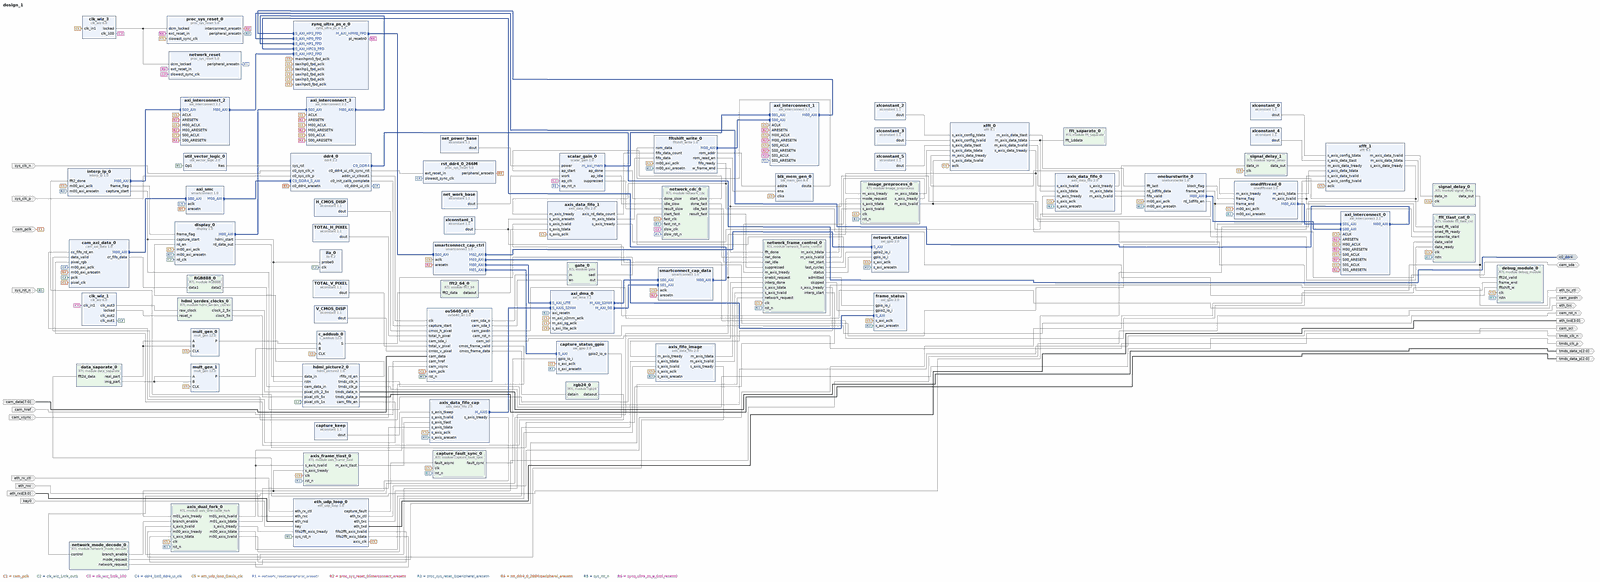
[diagram p0: block diagram of the top level, whole]
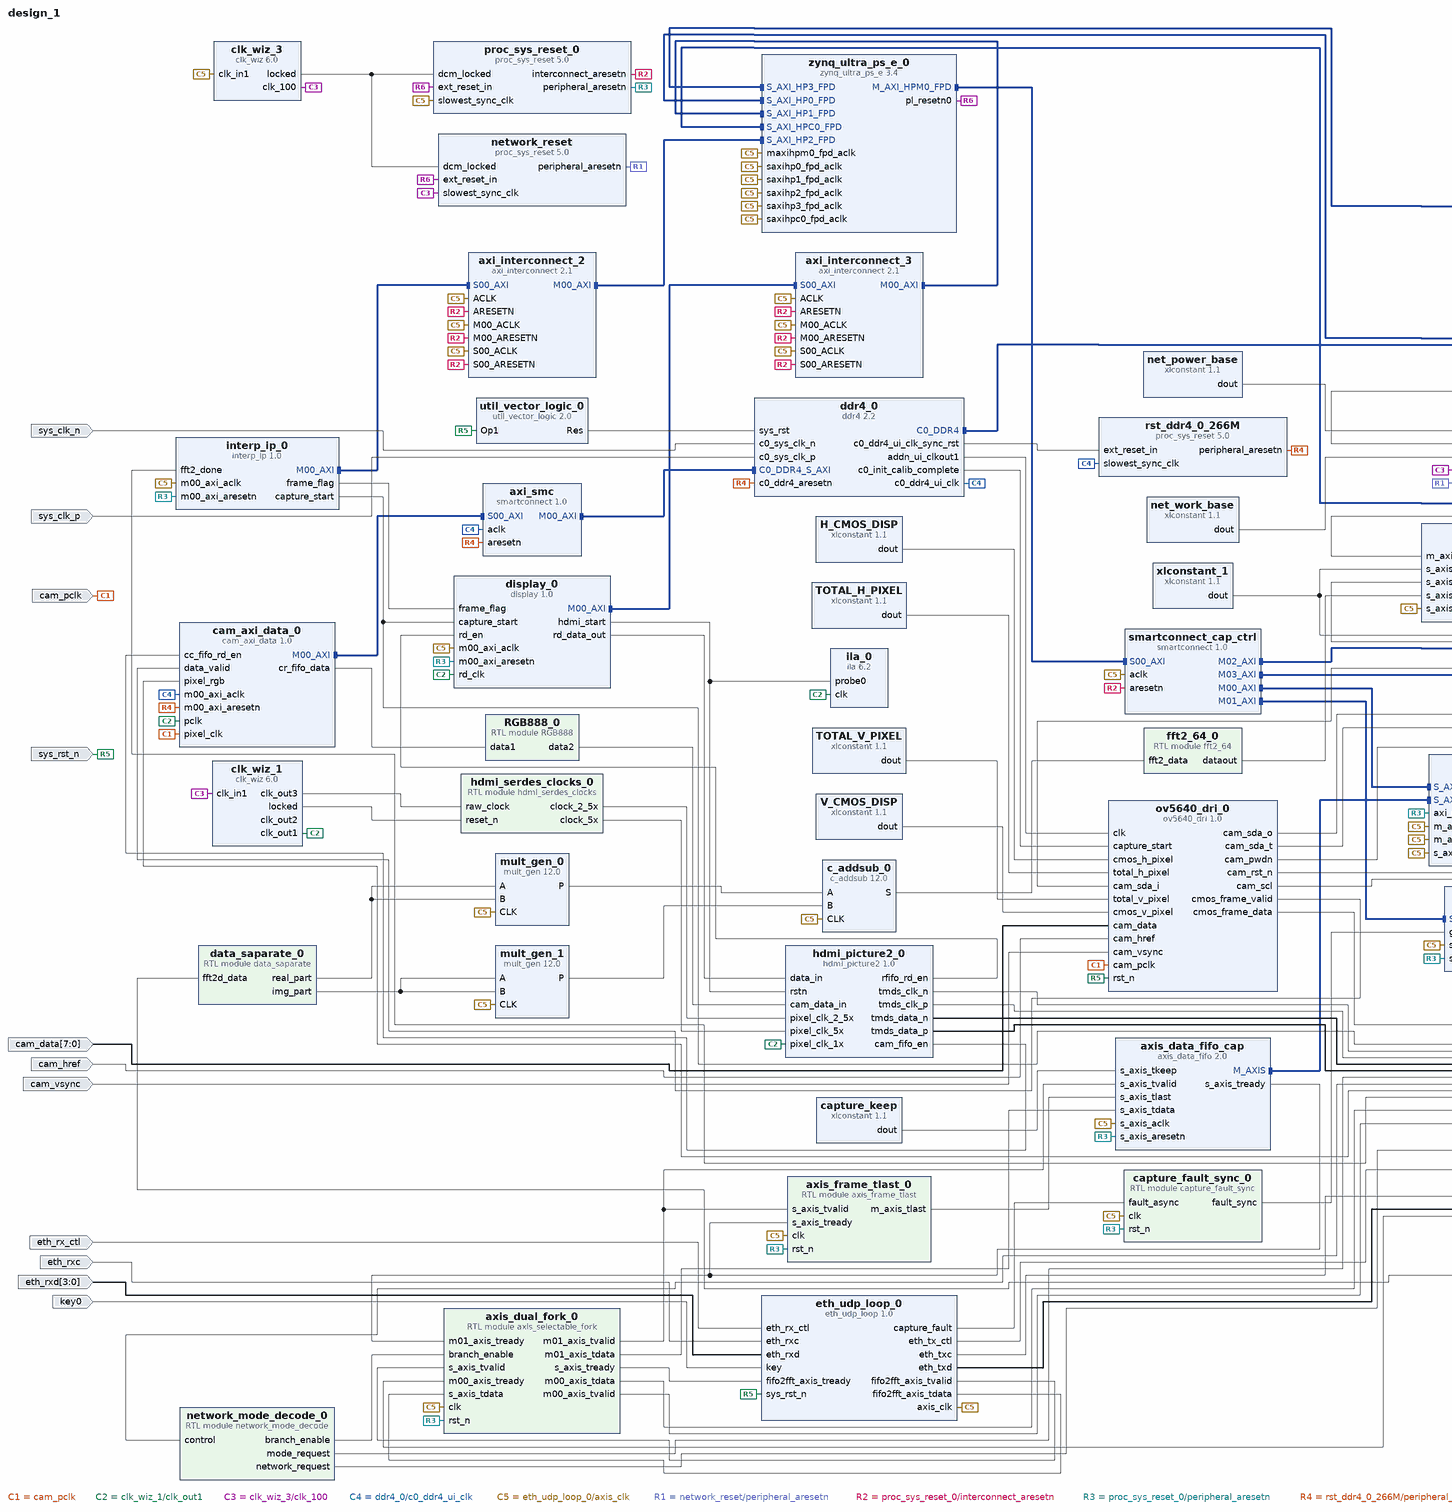
[diagram p1: block diagram of the top level, left part]
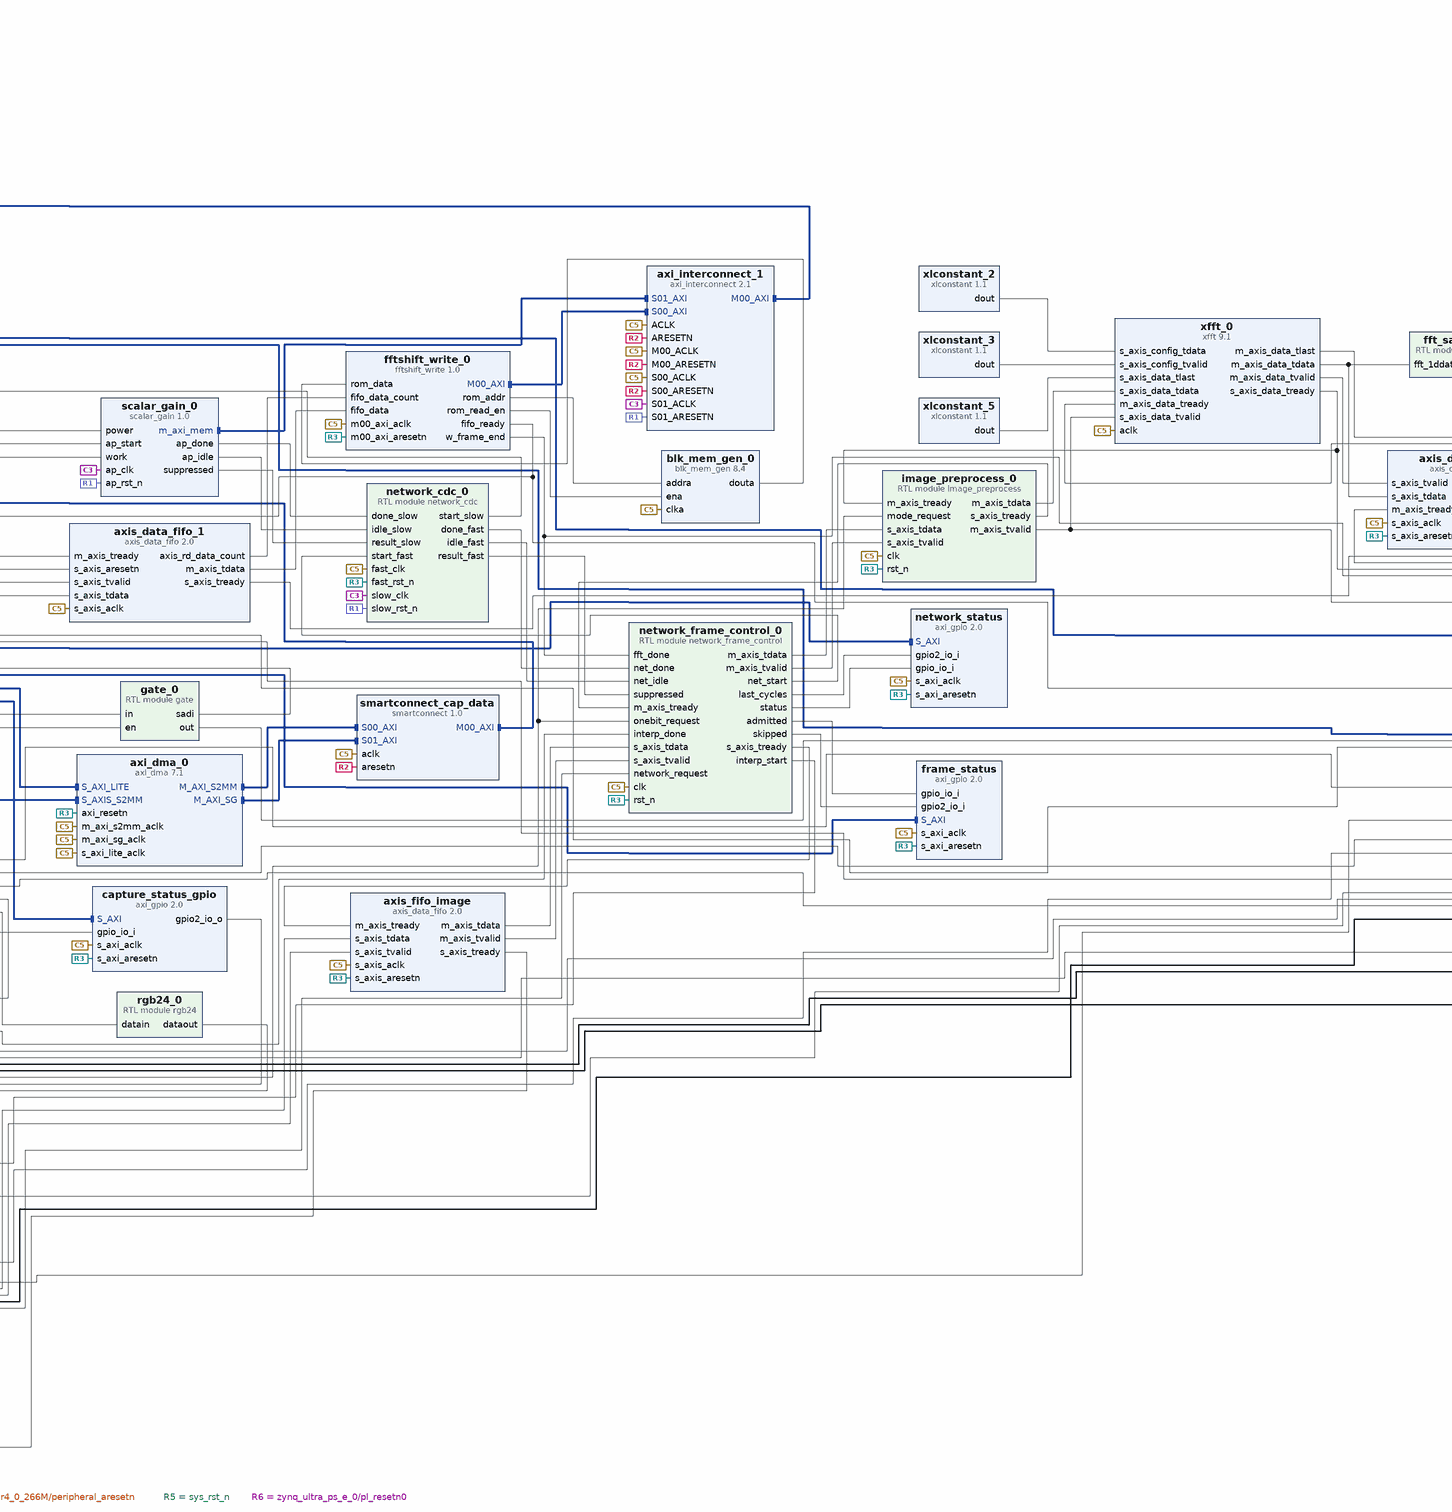
[diagram p2: block diagram of the top level, centre part]
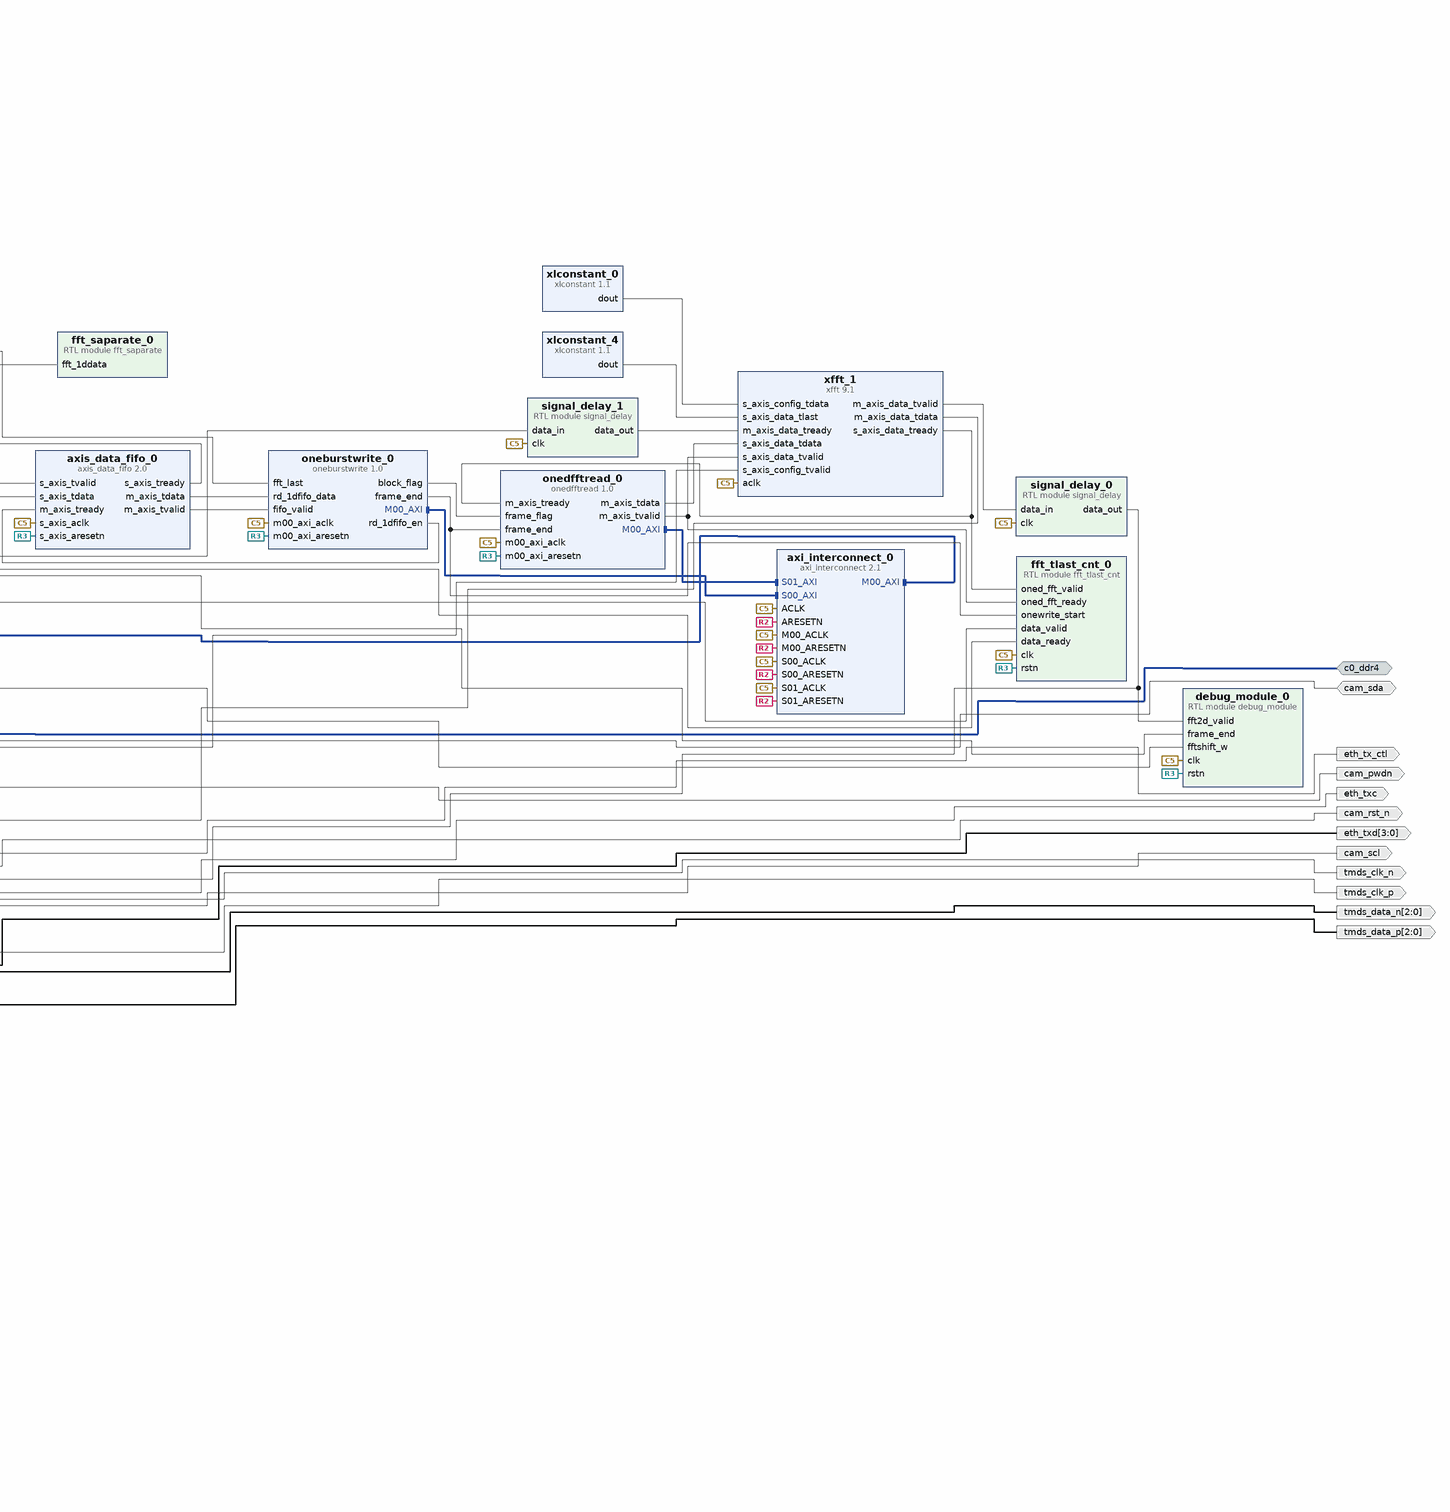
[diagram p3: block diagram of the top level, right part]
# Vivado block design design_1, xczu4ev-sfvc784-1-i, Vivado 2022.1
create_bd_design design_1

create_bd_intf_port -mode Master -vlnv xilinx.com:interface:ddr4_rtl:1.0 c0_ddr4
create_bd_port -dir O -from 2 -to 0 tmds_data_n
create_bd_port -dir O -type clk tmds_clk_n
set_property -dict {CONFIG.ASSOCIATED_RESET rst_n_0} [get_bd_ports tmds_clk_n]
create_bd_port -dir O -type clk tmds_clk_p
create_bd_port -dir O -from 2 -to 0 tmds_data_p
create_bd_port -dir I -type rst sys_rst_n
create_bd_port -dir I key0
create_bd_port -dir I eth_rxc
create_bd_port -dir I eth_rx_ctl
create_bd_port -dir I -from 3 -to 0 eth_rxd
create_bd_port -dir O eth_txc
create_bd_port -dir O eth_tx_ctl
create_bd_port -dir O -from 3 -to 0 eth_txd
create_bd_port -dir I cam_vsync
create_bd_port -dir I cam_href
create_bd_port -dir I -from 7 -to 0 cam_data
create_bd_port -dir O -type rst cam_rst_n
create_bd_port -dir O cam_pwdn
create_bd_port -dir O cam_scl
create_bd_port -dir I -type clk sys_clk_n
create_bd_port -dir I -type clk sys_clk_p
create_bd_port -dir IO cam_sda
create_bd_port -dir I -type clk cam_pclk
set_property -dict {CONFIG.FREQ_HZ 24000000} [get_bd_ports cam_pclk]

create_bd_cell -type ip -vlnv xilinx.com:ip:xfft:9.1 xfft_0
set_property -dict [list \
  CONFIG.aresetn false \
  CONFIG.complex_mult_type use_mults_performance \
  CONFIG.implementation_options radix_4_burst_io \
  CONFIG.memory_options_data block_ram \
  CONFIG.memory_options_hybrid false \
  CONFIG.memory_options_phase_factors block_ram \
  CONFIG.memory_options_reorder block_ram \
  CONFIG.number_of_stages_using_block_ram_for_data_and_phase_factors 0 \
  CONFIG.output_ordering natural_order \
  CONFIG.phase_factor_width 16 \
  CONFIG.rounding_modes convergent_rounding \
  CONFIG.scaling_options unscaled \
  CONFIG.target_clock_frequency 250 \
  CONFIG.throttle_scheme nonrealtime \
  CONFIG.xk_index true \
] [get_bd_cells xfft_0]
create_bd_cell -type ip -vlnv xilinx.com:ip:xlconstant:1.1 xlconstant_2
set_property -dict {CONFIG.CONST_WIDTH 8} [get_bd_cells xlconstant_2]
create_bd_cell -type ip -vlnv xilinx.com:ip:xlconstant:1.1 xlconstant_3
create_bd_cell -type ip -vlnv xilinx.com:ip:zynq_ultra_ps_e:3.4 zynq_ultra_ps_e_0
set_property -dict [list \
  CONFIG.CAN0_BOARD_INTERFACE custom \
  CONFIG.CAN1_BOARD_INTERFACE custom \
  CONFIG.CSU_BOARD_INTERFACE custom \
  CONFIG.DP_BOARD_INTERFACE custom \
  CONFIG.GEM0_BOARD_INTERFACE custom \
  CONFIG.GEM1_BOARD_INTERFACE custom \
  CONFIG.GEM2_BOARD_INTERFACE custom \
  CONFIG.GEM3_BOARD_INTERFACE custom \
  CONFIG.GPIO_BOARD_INTERFACE custom \
  CONFIG.IIC0_BOARD_INTERFACE custom \
  CONFIG.IIC1_BOARD_INTERFACE custom \
  CONFIG.NAND_BOARD_INTERFACE custom \
  CONFIG.PCIE_BOARD_INTERFACE custom \
  CONFIG.PJTAG_BOARD_INTERFACE custom \
  CONFIG.PMU_BOARD_INTERFACE custom \
  CONFIG.PSU_BANK_0_IO_STANDARD LVCMOS18 \
  CONFIG.PSU_BANK_1_IO_STANDARD LVCMOS33 \
  CONFIG.PSU_BANK_2_IO_STANDARD LVCMOS18 \
  CONFIG.PSU_BANK_3_IO_STANDARD LVCMOS33 \
  CONFIG.PSU_USB3__DUAL_CLOCK_ENABLE 0 \
  CONFIG.PSU__CAN1__PERIPHERAL__ENABLE 0 \
  CONFIG.PSU__CRF_APB__ACPU_CTRL__FREQMHZ 1200 \
  CONFIG.PSU__CRF_APB__ACPU_CTRL__SRCSEL APLL \
  CONFIG.PSU__CRF_APB__APLL_CTRL__SRCSEL PSS_REF_CLK \
  CONFIG.PSU__CRF_APB__DBG_FPD_CTRL__FREQMHZ 250 \
  CONFIG.PSU__CRF_APB__DBG_FPD_CTRL__SRCSEL IOPLL \
  CONFIG.PSU__CRF_APB__DBG_TRACE_CTRL__FREQMHZ 250 \
  CONFIG.PSU__CRF_APB__DBG_TRACE_CTRL__SRCSEL IOPLL \
  CONFIG.PSU__CRF_APB__DBG_TSTMP_CTRL__FREQMHZ 250 \
  CONFIG.PSU__CRF_APB__DBG_TSTMP_CTRL__SRCSEL IOPLL \
  CONFIG.PSU__CRF_APB__DDR_CTRL__FREQMHZ 1200 \
  CONFIG.PSU__CRF_APB__DDR_CTRL__SRCSEL DPLL \
  CONFIG.PSU__CRF_APB__DPDMA_REF_CTRL__FREQMHZ 600 \
  CONFIG.PSU__CRF_APB__DPDMA_REF_CTRL__SRCSEL DPLL \
  CONFIG.PSU__CRF_APB__DPLL_CTRL__SRCSEL PSS_REF_CLK \
  CONFIG.PSU__CRF_APB__DP_AUDIO_REF_CTRL__SRCSEL VPLL \
  CONFIG.PSU__CRF_APB__DP_STC_REF_CTRL__SRCSEL VPLL \
  CONFIG.PSU__CRF_APB__DP_VIDEO_REF_CTRL__SRCSEL DPLL \
  CONFIG.PSU__CRF_APB__GDMA_REF_CTRL__FREQMHZ 600 \
  CONFIG.PSU__CRF_APB__GDMA_REF_CTRL__SRCSEL DPLL \
  CONFIG.PSU__CRF_APB__GPU_REF_CTRL__FREQMHZ 600 \
  CONFIG.PSU__CRF_APB__GPU_REF_CTRL__SRCSEL DPLL \
  CONFIG.PSU__CRF_APB__TOPSW_LSBUS_CTRL__FREQMHZ 100 \
  CONFIG.PSU__CRF_APB__TOPSW_LSBUS_CTRL__SRCSEL IOPLL \
  CONFIG.PSU__CRF_APB__TOPSW_MAIN_CTRL__FREQMHZ 533.333 \
  CONFIG.PSU__CRF_APB__TOPSW_MAIN_CTRL__SRCSEL VPLL \
  CONFIG.PSU__CRF_APB__VPLL_CTRL__SRCSEL PSS_REF_CLK \
  CONFIG.PSU__CRL_APB__ADMA_REF_CTRL__FREQMHZ 500 \
  CONFIG.PSU__CRL_APB__ADMA_REF_CTRL__SRCSEL IOPLL \
  CONFIG.PSU__CRL_APB__CAN1_REF_CTRL__FREQMHZ 100 \
  CONFIG.PSU__CRL_APB__CAN1_REF_CTRL__SRCSEL IOPLL \
  CONFIG.PSU__CRL_APB__CPU_R5_CTRL__FREQMHZ 500 \
  CONFIG.PSU__CRL_APB__CPU_R5_CTRL__SRCSEL IOPLL \
  CONFIG.PSU__CRL_APB__DBG_LPD_CTRL__FREQMHZ 250 \
  CONFIG.PSU__CRL_APB__DBG_LPD_CTRL__SRCSEL IOPLL \
  CONFIG.PSU__CRL_APB__GEM3_REF_CTRL__FREQMHZ 125 \
  CONFIG.PSU__CRL_APB__GEM3_REF_CTRL__SRCSEL IOPLL \
  CONFIG.PSU__CRL_APB__I2C0_REF_CTRL__FREQMHZ 100 \
  CONFIG.PSU__CRL_APB__I2C0_REF_CTRL__SRCSEL IOPLL \
  CONFIG.PSU__CRL_APB__I2C1_REF_CTRL__FREQMHZ 100 \
  CONFIG.PSU__CRL_APB__I2C1_REF_CTRL__SRCSEL IOPLL \
  CONFIG.PSU__CRL_APB__IOPLL_CTRL__SRCSEL PSS_REF_CLK \
  CONFIG.PSU__CRL_APB__IOU_SWITCH_CTRL__FREQMHZ 267 \
  CONFIG.PSU__CRL_APB__IOU_SWITCH_CTRL__SRCSEL RPLL \
  CONFIG.PSU__CRL_APB__LPD_LSBUS_CTRL__FREQMHZ 100 \
  CONFIG.PSU__CRL_APB__LPD_LSBUS_CTRL__SRCSEL IOPLL \
  CONFIG.PSU__CRL_APB__LPD_SWITCH_CTRL__FREQMHZ 500 \
  CONFIG.PSU__CRL_APB__LPD_SWITCH_CTRL__SRCSEL IOPLL \
  CONFIG.PSU__CRL_APB__PCAP_CTRL__FREQMHZ 200 \
  CONFIG.PSU__CRL_APB__PCAP_CTRL__SRCSEL IOPLL \
  CONFIG.PSU__CRL_APB__QSPI_REF_CTRL__FREQMHZ 300 \
  CONFIG.PSU__CRL_APB__QSPI_REF_CTRL__SRCSEL IOPLL \
  CONFIG.PSU__CRL_APB__RPLL_CTRL__SRCSEL PSS_REF_CLK \
  CONFIG.PSU__CRL_APB__SDIO1_REF_CTRL__FREQMHZ 200 \
  CONFIG.PSU__CRL_APB__SDIO1_REF_CTRL__SRCSEL RPLL \
  CONFIG.PSU__CRL_APB__TIMESTAMP_REF_CTRL__FREQMHZ 100 \
  CONFIG.PSU__CRL_APB__TIMESTAMP_REF_CTRL__SRCSEL PSS_REF_CLK \
  CONFIG.PSU__CRL_APB__UART0_REF_CTRL__FREQMHZ 100 \
  CONFIG.PSU__CRL_APB__UART0_REF_CTRL__SRCSEL IOPLL \
  CONFIG.PSU__CRL_APB__UART1_REF_CTRL__FREQMHZ 100 \
  CONFIG.PSU__CRL_APB__UART1_REF_CTRL__SRCSEL IOPLL \
  CONFIG.PSU__CRL_APB__USB0_BUS_REF_CTRL__FREQMHZ 250 \
  CONFIG.PSU__CRL_APB__USB0_BUS_REF_CTRL__SRCSEL IOPLL \
  CONFIG.PSU__CRL_APB__USB3_DUAL_REF_CTRL__FREQMHZ 20 \
  CONFIG.PSU__CRL_APB__USB3_DUAL_REF_CTRL__SRCSEL IOPLL \
  CONFIG.PSU__CRL_APB__USB3__ENABLE 0 \
  CONFIG.PSU__CSUPMU__PERIPHERAL__VALID 0 \
  CONFIG.PSU__DDRC__BUS_WIDTH {64 Bit} \
  CONFIG.PSU__DDRC__COMPONENTS Components \
  CONFIG.PSU__DDRC__DEVICE_CAPACITY {4096 MBits} \
  CONFIG.PSU__DDRC__DRAM_WIDTH {16 Bits} \
  CONFIG.PSU__DDRC__ECC Disabled \
  CONFIG.PSU__DDRC__MEMORY_TYPE {DDR 4} \
  CONFIG.PSU__DDRC__SPEED_BIN DDR4_2400P \
  CONFIG.PSU__DDR_HIGH_ADDRESS_GUI_ENABLE 0 \
  CONFIG.PSU__DDR__INTERFACE__FREQMHZ 600.000 \
  CONFIG.PSU__DEVICE_TYPE EV \
  CONFIG.PSU__DISPLAYPORT__PERIPHERAL__ENABLE 0 \
  CONFIG.PSU__DLL__ISUSED 1 \
  CONFIG.PSU__ENET3__PERIPHERAL__ENABLE 0 \
  CONFIG.PSU__FPD_SLCR__WDT1__FREQMHZ 100 \
  CONFIG.PSU__FPGA_PL0_ENABLE 0 \
  CONFIG.PSU__GPIO0_MIO__PERIPHERAL__ENABLE 0 \
  CONFIG.PSU__GPIO1_MIO__PERIPHERAL__ENABLE 0 \
  CONFIG.PSU__GPIO_EMIO__PERIPHERAL__ENABLE 1 \
  CONFIG.PSU__GPIO_EMIO__PERIPHERAL__IO 1 \
  CONFIG.PSU__I2C0__PERIPHERAL__ENABLE 0 \
  CONFIG.PSU__I2C1__PERIPHERAL__ENABLE 0 \
  CONFIG.PSU__IOU_SLCR__IOU_TTC_APB_CLK__TTC0_SEL APB \
  CONFIG.PSU__IOU_SLCR__IOU_TTC_APB_CLK__TTC1_SEL APB \
  CONFIG.PSU__IOU_SLCR__IOU_TTC_APB_CLK__TTC2_SEL APB \
  CONFIG.PSU__IOU_SLCR__IOU_TTC_APB_CLK__TTC3_SEL APB \
  CONFIG.PSU__IOU_SLCR__TTC0__FREQMHZ 100 \
  CONFIG.PSU__IOU_SLCR__TTC1__FREQMHZ 100 \
  CONFIG.PSU__IOU_SLCR__TTC2__FREQMHZ 100 \
  CONFIG.PSU__IOU_SLCR__TTC3__FREQMHZ 100 \
  CONFIG.PSU__IOU_SLCR__WDT0__FREQMHZ 100 \
  CONFIG.PSU__LPD_SLCR__CSUPMU__FREQMHZ 100 \
  CONFIG.PSU__MAXIGP0__DATA_WIDTH 128 \
  CONFIG.PSU__OVERRIDE_HPX_QOS 0 \
  CONFIG.PSU__OVERRIDE__BASIC_CLOCK 0 \
  CONFIG.PSU__PMU__PERIPHERAL__ENABLE 0 \
  CONFIG.PSU__PRESET_APPLIED 0 \
  CONFIG.PSU__PSS_REF_CLK__FREQMHZ 33.333 \
  CONFIG.PSU__QSPI__PERIPHERAL__ENABLE 0 \
  CONFIG.PSU__SATA__PERIPHERAL__ENABLE 0 \
  CONFIG.PSU__SAXIGP2__DATA_WIDTH 64 \
  CONFIG.PSU__SAXIGP3__DATA_WIDTH 64 \
  CONFIG.PSU__SAXIGP4__DATA_WIDTH 64 \
  CONFIG.PSU__SAXIGP5__DATA_WIDTH 64 \
  CONFIG.PSU__SD0__CLK_100_SDR_OTAP_DLY 0x3 \
  CONFIG.PSU__SD0__CLK_200_SDR_OTAP_DLY 0x3 \
  CONFIG.PSU__SD0__CLK_50_DDR_ITAP_DLY 0x3D \
  CONFIG.PSU__SD0__CLK_50_DDR_OTAP_DLY 0x4 \
  CONFIG.PSU__SD0__CLK_50_SDR_ITAP_DLY 0x15 \
  CONFIG.PSU__SD0__CLK_50_SDR_OTAP_DLY 0x5 \
  CONFIG.PSU__SD1_COHERENCY 0 \
  CONFIG.PSU__SD1_ROUTE_THROUGH_FPD 0 \
  CONFIG.PSU__SD1__CLK_50_SDR_ITAP_DLY 0x15 \
  CONFIG.PSU__SD1__CLK_50_SDR_OTAP_DLY 0x5 \
  CONFIG.PSU__SD1__DATA_TRANSFER_MODE 4Bit \
  CONFIG.PSU__SD1__GRP_CD__ENABLE 1 \
  CONFIG.PSU__SD1__GRP_CD__IO {MIO 45} \
  CONFIG.PSU__SD1__GRP_POW__ENABLE 0 \
  CONFIG.PSU__SD1__GRP_WP__ENABLE 0 \
  CONFIG.PSU__SD1__PERIPHERAL__ENABLE 1 \
  CONFIG.PSU__SD1__PERIPHERAL__IO {MIO 46 .. 51} \
  CONFIG.PSU__SD1__SLOT_TYPE {SD 2.0} \
  CONFIG.PSU__SWDT0__PERIPHERAL__ENABLE 0 \
  CONFIG.PSU__SWDT1__PERIPHERAL__ENABLE 0 \
  CONFIG.PSU__TTC0__PERIPHERAL__ENABLE 0 \
  CONFIG.PSU__TTC1__PERIPHERAL__ENABLE 0 \
  CONFIG.PSU__TTC2__PERIPHERAL__ENABLE 0 \
  CONFIG.PSU__TTC3__PERIPHERAL__ENABLE 0 \
  CONFIG.PSU__UART0__BAUD_RATE 115200 \
  CONFIG.PSU__UART0__MODEM__ENABLE 0 \
  CONFIG.PSU__UART0__PERIPHERAL__ENABLE 1 \
  CONFIG.PSU__UART0__PERIPHERAL__IO {MIO 42 .. 43} \
  CONFIG.PSU__UART1__PERIPHERAL__ENABLE 0 \
  CONFIG.PSU__USB0__PERIPHERAL__ENABLE 0 \
  CONFIG.PSU__USE__IRQ0 0 \
  CONFIG.PSU__USE__M_AXI_GP0 1 \
  CONFIG.PSU__USE__M_AXI_GP1 0 \
  CONFIG.PSU__USE__M_AXI_GP2 0 \
  CONFIG.PSU__USE__S_AXI_GP0 1 \
  CONFIG.PSU__USE__S_AXI_GP2 1 \
  CONFIG.PSU__USE__S_AXI_GP3 1 \
  CONFIG.PSU__USE__S_AXI_GP4 1 \
  CONFIG.PSU__USE__S_AXI_GP5 1 \
  CONFIG.QSPI_BOARD_INTERFACE custom \
  CONFIG.SATA_BOARD_INTERFACE custom \
  CONFIG.SD0_BOARD_INTERFACE custom \
  CONFIG.SD1_BOARD_INTERFACE custom \
  CONFIG.SPI0_BOARD_INTERFACE custom \
  CONFIG.SPI1_BOARD_INTERFACE custom \
  CONFIG.SUBPRESET1 DDR4_MICRON_MT40A256M16GE_083E \
  CONFIG.SUBPRESET2 Custom \
  CONFIG.SWDT0_BOARD_INTERFACE custom \
  CONFIG.SWDT1_BOARD_INTERFACE custom \
  CONFIG.TRACE_BOARD_INTERFACE custom \
  CONFIG.TTC0_BOARD_INTERFACE custom \
  CONFIG.TTC1_BOARD_INTERFACE custom \
  CONFIG.TTC2_BOARD_INTERFACE custom \
  CONFIG.TTC3_BOARD_INTERFACE custom \
  CONFIG.UART0_BOARD_INTERFACE custom \
  CONFIG.UART1_BOARD_INTERFACE custom \
  CONFIG.USB0_BOARD_INTERFACE custom \
  CONFIG.USB1_BOARD_INTERFACE custom \
  CONFIG.preset None \
] [get_bd_cells zynq_ultra_ps_e_0]
# 743 more settings of zynq_ultra_ps_e_0 are not shown: defaults, MIO pin electricals, DDR timing, and values the tool derives
create_bd_cell -type module -reference fft_saparate fft_saparate_0
create_bd_cell -type ip -vlnv xilinx.com:ip:proc_sys_reset:5.0 proc_sys_reset_0
create_bd_cell -type ip -vlnv xilinx.com:ip:axi_interconnect:2.1 axi_interconnect_0
set_property -dict [list \
  CONFIG.ENABLE_ADVANCED_OPTIONS 0 \
  CONFIG.NUM_MI 1 \
  CONFIG.NUM_SI 2 \
  CONFIG.S00_ARB_PRIORITY 0 \
  CONFIG.S01_ARB_PRIORITY 0 \
  CONFIG.S02_ARB_PRIORITY 1 \
] [get_bd_cells axi_interconnect_0]
create_bd_cell -type ip -vlnv xilinx.com:ip:xfft:9.1 xfft_1
set_property -dict [list \
  CONFIG.complex_mult_type use_mults_performance \
  CONFIG.implementation_options radix_4_burst_io \
  CONFIG.input_width 27 \
  CONFIG.number_of_stages_using_block_ram_for_data_and_phase_factors 0 \
  CONFIG.output_ordering natural_order \
  CONFIG.rounding_modes convergent_rounding \
  CONFIG.scaling_options unscaled \
  CONFIG.transform_length 512 \
  CONFIG.xk_index true \
] [get_bd_cells xfft_1]
create_bd_cell -type ip -vlnv xilinx.com:ip:xlconstant:1.1 xlconstant_0
set_property -dict {CONFIG.CONST_WIDTH 8} [get_bd_cells xlconstant_0]
create_bd_cell -type ip -vlnv xilinx.com:ip:xlconstant:1.1 xlconstant_1
create_bd_cell -type ip -vlnv xilinx.com:ip:xlconstant:1.1 xlconstant_4
set_property -dict {CONFIG.CONST_VAL 0} [get_bd_cells xlconstant_4]
create_bd_cell -type module -reference fft_tlast_cnt fft_tlast_cnt_0
create_bd_cell -type ip -vlnv xilinx.com:ip:mult_gen:12.0 mult_gen_0
set_property -dict [list \
  CONFIG.ClockEnable false \
  CONFIG.PipeStages 7 \
  CONFIG.PortAWidth 37 \
  CONFIG.PortBWidth 37 \
] [get_bd_cells mult_gen_0]
create_bd_cell -type ip -vlnv xilinx.com:ip:mult_gen:12.0 mult_gen_1
set_property -dict {CONFIG.PipeStages 7 CONFIG.PortAWidth 37 CONFIG.PortBWidth 37} [get_bd_cells mult_gen_1]
create_bd_cell -type ip -vlnv xilinx.com:ip:c_addsub:12.0 c_addsub_0
set_property -dict [list \
  CONFIG.A_Width 74 \
  CONFIG.B_Value 00000000000000000000000000000000000000000000000000000000000000000000000000 \
  CONFIG.B_Width 74 \
  CONFIG.CE false \
  CONFIG.Latency 4 \
  CONFIG.Out_Width 74 \
] [get_bd_cells c_addsub_0]
create_bd_cell -type ip -vlnv xilinx.com:ip:axis_data_fifo:2.0 axis_data_fifo_1
set_property -dict [list \
  CONFIG.FIFO_DEPTH 2048 \
  CONFIG.FIFO_MEMORY_TYPE ultra \
  CONFIG.HAS_RD_DATA_COUNT 1 \
  CONFIG.TDATA_NUM_BYTES 8 \
] [get_bd_cells axis_data_fifo_1]
create_bd_cell -type module -reference signal_delay signal_delay_0
create_bd_cell -type module -reference signal_delay signal_delay_1
create_bd_cell -type ip -vlnv xilinx.com:ip:blk_mem_gen:8.4 blk_mem_gen_0
set_property -dict [list \
  CONFIG.Coe_File ../../../../../../../FFTSHIFT.coe \
  CONFIG.Enable_32bit_Address false \
  CONFIG.Load_Init_File true \
  CONFIG.Memory_Type Single_Port_ROM \
  CONFIG.Port_A_Write_Rate 0 \
  CONFIG.Register_PortA_Output_of_Memory_Primitives false \
  CONFIG.Use_RSTA_Pin false \
  CONFIG.Write_Depth_A 2048 \
  CONFIG.use_bram_block Stand_Alone \
] [get_bd_cells blk_mem_gen_0]
create_bd_cell -type ip -vlnv xilinx.com:ip:axi_interconnect:2.1 axi_interconnect_1
set_property -dict [list \
  CONFIG.ENABLE_ADVANCED_OPTIONS 0 \
  CONFIG.NUM_MI 1 \
  CONFIG.NUM_SI 2 \
  CONFIG.S00_ARB_PRIORITY 0 \
  CONFIG.S01_ARB_PRIORITY 1 \
] [get_bd_cells axi_interconnect_1]
create_bd_cell -type module -reference debug_module debug_module_0
create_bd_cell -type ip -vlnv xilinx.com:ip:axi_interconnect:2.1 axi_interconnect_2
set_property -dict {CONFIG.NUM_MI 1 CONFIG.NUM_SI 1} [get_bd_cells axi_interconnect_2]
create_bd_cell -type ip -vlnv xilinx.com:ip:clk_wiz:6.0 clk_wiz_1
set_property -dict [list \
  CONFIG.CLKOUT1_JITTER 250.227 \
  CONFIG.CLKOUT1_PHASE_ERROR 394.762 \
  CONFIG.CLKOUT1_REQUESTED_OUT_FREQ 74.25 \
  CONFIG.CLKOUT2_JITTER 222.018 \
  CONFIG.CLKOUT2_PHASE_ERROR 394.762 \
  CONFIG.CLKOUT2_REQUESTED_OUT_FREQ 185.625 \
  CONFIG.CLKOUT2_USED true \
  CONFIG.CLKOUT3_DRIVES No_buffer \
  CONFIG.CLKOUT3_JITTER 203.119 \
  CONFIG.CLKOUT3_PHASE_ERROR 394.762 \
  CONFIG.CLKOUT3_REQUESTED_OUT_FREQ 371.25 \
  CONFIG.CLKOUT3_USED true \
  CONFIG.MMCM_CLKFBOUT_MULT_F 111.375 \
  CONFIG.MMCM_CLKOUT0_DIVIDE_F 15.000 \
  CONFIG.MMCM_CLKOUT1_DIVIDE 6 \
  CONFIG.MMCM_CLKOUT2_DIVIDE 3 \
  CONFIG.MMCM_DIVCLK_DIVIDE 10 \
  CONFIG.NUM_OUT_CLKS 3 \
  CONFIG.OPTIMIZE_CLOCKING_STRUCTURE_EN true \
  CONFIG.USE_LOCKED true \
  CONFIG.USE_RESET false \
] [get_bd_cells clk_wiz_1]
create_bd_cell -type ip -vlnv xilinx.com:ip:axi_interconnect:2.1 axi_interconnect_3
set_property -dict {CONFIG.NUM_MI 1} [get_bd_cells axi_interconnect_3]
create_bd_cell -type ip -vlnv xilinx.com:ip:axis_data_fifo:2.0 axis_data_fifo_0
set_property -dict [list \
  CONFIG.ENABLE_ECC 0 \
  CONFIG.FIFO_DEPTH 16384 \
  CONFIG.FIFO_MEMORY_TYPE ultra \
  CONFIG.FIFO_MODE 1 \
  CONFIG.HAS_RD_DATA_COUNT 1 \
  CONFIG.HAS_WR_DATA_COUNT 1 \
  CONFIG.TDATA_NUM_BYTES 8 \
] [get_bd_cells axis_data_fifo_0]
create_bd_cell -type ip -vlnv xilinx.com:user:onedfftread:1.0 onedfftread_0
set_property -dict [list \
  CONFIG.C_M00_AXI_BURST_LEN 256 \
  CONFIG.C_M00_AXI_DATA_WIDTH 64 \
  CONFIG.C_M00_AXI_TARGET_SLAVE_BASE_ADDR 0x02000000 \
] [get_bd_cells onedfftread_0]
create_bd_cell -type module -reference data_saparate data_saparate_0
create_bd_cell -type module -reference fft2_64 fft2_64_0
create_bd_cell -type ip -vlnv xilinx.com:ip:xlconstant:1.1 xlconstant_5
set_property -dict {CONFIG.CONST_VAL 0} [get_bd_cells xlconstant_5]
create_bd_cell -type ip -vlnv xilinx.com:ip:clk_wiz:6.0 clk_wiz_3
set_property -dict [list \
  CONFIG.CLKIN1_JITTER_PS 40.0 \
  CONFIG.CLKOUT1_DRIVES Buffer \
  CONFIG.CLKOUT1_JITTER 107.111 \
  CONFIG.CLKOUT1_PHASE_ERROR 85.928 \
  CONFIG.CLKOUT1_REQUESTED_OUT_FREQ 100 \
  CONFIG.CLKOUT2_DRIVES Buffer \
  CONFIG.CLKOUT2_JITTER 107.111 \
  CONFIG.CLKOUT2_PHASE_ERROR 85.928 \
  CONFIG.CLKOUT2_USED false \
  CONFIG.CLKOUT3_DRIVES Buffer \
  CONFIG.CLKOUT4_DRIVES Buffer \
  CONFIG.CLKOUT5_DRIVES Buffer \
  CONFIG.CLKOUT6_DRIVES Buffer \
  CONFIG.CLKOUT7_DRIVES Buffer \
  CONFIG.CLK_OUT1_PORT clk_100 \
  CONFIG.CLK_OUT2_PORT clk_100 \
  CONFIG.MMCM_BANDWIDTH OPTIMIZED \
  CONFIG.MMCM_CLKFBOUT_MULT_F 4 \
  CONFIG.MMCM_CLKIN1_PERIOD 4.000 \
  CONFIG.MMCM_CLKIN2_PERIOD 10.0 \
  CONFIG.MMCM_CLKOUT0_DIVIDE_F 10 \
  CONFIG.MMCM_CLKOUT1_DIVIDE 1 \
  CONFIG.MMCM_COMPENSATION AUTO \
  CONFIG.MMCM_DIVCLK_DIVIDE 1 \
  CONFIG.NUM_OUT_CLKS 1 \
  CONFIG.PRIMITIVE PLL \
  CONFIG.PRIM_IN_FREQ 250.000 \
  CONFIG.USE_RESET false \
] [get_bd_cells clk_wiz_3]
create_bd_cell -type ip -vlnv xilinx.com:user:oneburstwrite:1.0 oneburstwrite_0
set_property -dict [list \
  CONFIG.C_M00_AXI_BURST_LEN 1 \
  CONFIG.C_M00_AXI_DATA_WIDTH 64 \
  CONFIG.C_M00_AXI_TARGET_SLAVE_BASE_ADDR 0x02000000 \
] [get_bd_cells oneburstwrite_0]
create_bd_cell -type ip -vlnv xilinx.com:user:ov5640_dri:1.0 ov5640_dri_0
create_bd_cell -type ip -vlnv xilinx.com:ip:ddr4:2.2 ddr4_0
set_property -dict [list \
  CONFIG.ADDN_UI_CLKOUT1_FREQ_HZ 50 \
  CONFIG.C0.BANK_GROUP_WIDTH 1 \
  CONFIG.C0.DDR4_AxiAddressWidth 29 \
  CONFIG.C0.DDR4_AxiDataWidth 32 \
  CONFIG.C0.DDR4_DataWidth 16 \
  CONFIG.C0.DDR4_InputClockPeriod 10006 \
  CONFIG.C0.DDR4_MemoryPart MT40A256M16GE-083E \
] [get_bd_cells ddr4_0]
create_bd_cell -type ip -vlnv xilinx.com:ip:util_vector_logic:2.0 util_vector_logic_0
set_property -dict {CONFIG.C_OPERATION not CONFIG.C_SIZE 1} [get_bd_cells util_vector_logic_0]
create_bd_cell -type module -reference gate gate_0
create_bd_cell -type module -reference rgb24 rgb24_0
create_bd_cell -type ip -vlnv xilinx.com:ip:smartconnect:1.0 axi_smc
set_property -dict {CONFIG.NUM_SI 1} [get_bd_cells axi_smc]
create_bd_cell -type ip -vlnv xilinx.com:ip:proc_sys_reset:5.0 rst_ddr4_0_266M
create_bd_cell -type module -reference RGB888 RGB888_0
create_bd_cell -type ip -vlnv xilinx.com:ip:xlconstant:1.1 H_CMOS_DISP
set_property -dict {CONFIG.CONST_VAL 480 CONFIG.CONST_WIDTH 13} [get_bd_cells H_CMOS_DISP]
create_bd_cell -type ip -vlnv xilinx.com:ip:xlconstant:1.1 V_CMOS_DISP
set_property -dict {CONFIG.CONST_VAL 272 CONFIG.CONST_WIDTH 13} [get_bd_cells V_CMOS_DISP]
create_bd_cell -type ip -vlnv xilinx.com:ip:xlconstant:1.1 TOTAL_H_PIXEL
set_property -dict {CONFIG.CONST_VAL 1800 CONFIG.CONST_WIDTH 13} [get_bd_cells TOTAL_H_PIXEL]
create_bd_cell -type ip -vlnv xilinx.com:ip:xlconstant:1.1 TOTAL_V_PIXEL
set_property -dict {CONFIG.CONST_VAL 1000 CONFIG.CONST_WIDTH 13} [get_bd_cells TOTAL_V_PIXEL]
create_bd_cell -type ip -vlnv xilinx.com:ip:ila:6.2 ila_0
set_property -dict {CONFIG.C_ENABLE_ILA_AXI_MON false CONFIG.C_MONITOR_TYPE Native CONFIG.C_NUM_OF_PROBES 1} [get_bd_cells ila_0]
create_bd_cell -type ip -vlnv xilinx.com:user:eth_udp_loop:1.0 eth_udp_loop_0
set_property -dict {CONFIG.DES_MAC 0x123456789012} [get_bd_cells eth_udp_loop_0]
create_bd_cell -type ip -vlnv xilinx.com:ip:axis_data_fifo:2.0 axis_fifo_image
set_property -dict [list \
  CONFIG.FIFO_DEPTH 16384 \
  CONFIG.FIFO_MEMORY_TYPE ultra \
  CONFIG.HAS_RD_DATA_COUNT 1 \
  CONFIG.HAS_TKEEP 0 \
  CONFIG.HAS_TLAST 0 \
  CONFIG.TDATA_NUM_BYTES 4 \
] [get_bd_cells axis_fifo_image]
create_bd_cell -type ip -vlnv xilinx.com:ip:axis_data_fifo:2.0 axis_data_fifo_cap
set_property -dict [list \
  CONFIG.FIFO_DEPTH 4096 \
  CONFIG.FIFO_MEMORY_TYPE ultra \
  CONFIG.HAS_RD_DATA_COUNT 1 \
  CONFIG.HAS_TKEEP 1 \
  CONFIG.HAS_TLAST 1 \
  CONFIG.TDATA_NUM_BYTES 4 \
] [get_bd_cells axis_data_fifo_cap]
create_bd_cell -type module -reference image_preprocess image_preprocess_0
create_bd_cell -type module -reference axis_frame_tlast axis_frame_tlast_0
create_bd_cell -type ip -vlnv xilinx.com:ip:xlconstant:1.1 capture_keep
set_property -dict {CONFIG.CONST_VAL 15 CONFIG.CONST_WIDTH 4} [get_bd_cells capture_keep]
create_bd_cell -type ip -vlnv xilinx.com:ip:axi_dma:7.1 axi_dma_0
set_property -dict [list \
  CONFIG.c_addr_width 32 \
  CONFIG.c_include_mm2s 0 \
  CONFIG.c_include_s2mm 1 \
  CONFIG.c_include_sg 1 \
  CONFIG.c_m_axi_s2mm_data_width 32 \
  CONFIG.c_s2mm_burst_size 16 \
  CONFIG.c_s_axis_s2mm_tdata_width 32 \
  CONFIG.c_sg_include_stscntrl_strm 0 \
  CONFIG.c_sg_length_width 23 \
] [get_bd_cells axi_dma_0]
create_bd_cell -type ip -vlnv xilinx.com:ip:smartconnect:1.0 smartconnect_cap_data
set_property -dict {CONFIG.NUM_MI 1 CONFIG.NUM_SI 2} [get_bd_cells smartconnect_cap_data]
create_bd_cell -type ip -vlnv xilinx.com:ip:smartconnect:1.0 smartconnect_cap_ctrl
set_property -dict {CONFIG.NUM_MI 4 CONFIG.NUM_SI 1} [get_bd_cells smartconnect_cap_ctrl]
create_bd_cell -type ip -vlnv xilinx.com:ip:axi_gpio:2.0 capture_status_gpio
set_property -dict [list \
  CONFIG.C_ALL_INPUTS 1 \
  CONFIG.C_ALL_INPUTS_2 0 \
  CONFIG.C_ALL_OUTPUTS_2 1 \
  CONFIG.C_DOUT_DEFAULT_2 0x00000000 \
  CONFIG.C_GPIO2_WIDTH 4 \
  CONFIG.C_GPIO_WIDTH 4 \
  CONFIG.C_IS_DUAL 1 \
] [get_bd_cells capture_status_gpio]
create_bd_cell -type module -reference capture_fault_sync capture_fault_sync_0
create_bd_cell -type module -reference axis_selectable_fork axis_dual_fork_0
create_bd_cell -type module -reference network_frame_control network_frame_control_0
create_bd_cell -type module -reference network_cdc network_cdc_0
create_bd_cell -type ip -vlnv xilinx.com:ip:proc_sys_reset:5.0 network_reset
create_bd_cell -type ip -vlnv xilinx.com:ip:xlconstant:1.1 net_power_base
set_property -dict {CONFIG.CONST_VAL 0x24000000 CONFIG.CONST_WIDTH 32} [get_bd_cells net_power_base]
create_bd_cell -type ip -vlnv xilinx.com:ip:xlconstant:1.1 net_work_base
set_property -dict {CONFIG.CONST_VAL 0x31000000 CONFIG.CONST_WIDTH 32} [get_bd_cells net_work_base]
create_bd_cell -type module -reference network_mode_decode network_mode_decode_0
create_bd_cell -type ip -vlnv xilinx.com:ip:axi_gpio:2.0 network_status
set_property -dict [list \
  CONFIG.C_ALL_INPUTS 1 \
  CONFIG.C_ALL_INPUTS_2 1 \
  CONFIG.C_GPIO2_WIDTH 32 \
  CONFIG.C_GPIO_WIDTH 32 \
  CONFIG.C_IS_DUAL 1 \
] [get_bd_cells network_status]
create_bd_cell -type ip -vlnv xilinx.com:ip:axi_gpio:2.0 frame_status
set_property -dict [list \
  CONFIG.C_ALL_INPUTS 1 \
  CONFIG.C_ALL_INPUTS_2 1 \
  CONFIG.C_GPIO2_WIDTH 32 \
  CONFIG.C_GPIO_WIDTH 32 \
  CONFIG.C_IS_DUAL 1 \
] [get_bd_cells frame_status]
create_bd_cell -type ip -vlnv xilinx.com:user:fftshift_write:1.0 fftshift_write_0
set_property -dict [list \
  CONFIG.C_M00_AXI_BURST_LEN 256 \
  CONFIG.C_M00_AXI_DATA_WIDTH 64 \
  CONFIG.C_M00_AXI_TARGET_SLAVE_BASE_ADDR 0x24000000 \
] [get_bd_cells fftshift_write_0]
create_bd_cell -type module -reference hdmi_serdes_clocks hdmi_serdes_clocks_0
create_bd_cell -type ip -vlnv xilinx.com:user:cam_axi_data:1.0 cam_axi_data_0
set_property -dict [list \
  CONFIG.C_M00_AXI_BURST_LEN 256 \
  CONFIG.C_M00_AXI_TARGET_SLAVE_BASE_ADDR 0x80000000 \
] [get_bd_cells cam_axi_data_0]
create_bd_cell -type ip -vlnv xilinx.com:user:display:1.0 display_0
set_property -dict [list \
  CONFIG.C_M00_AXI_BURST_LEN 256 \
  CONFIG.C_M00_AXI_DATA_WIDTH 64 \
  CONFIG.C_M00_AXI_TARGET_SLAVE_BASE_ADDR 0x25000000 \
] [get_bd_cells display_0]
create_bd_cell -type ip -vlnv xilinx.com:user:hdmi_picture2:1.0 hdmi_picture2_0
create_bd_cell -type ip -vlnv xilinx.com:user:interp_ip:1.0 interp_ip_0
set_property -dict [list \
  CONFIG.C_M00_AXI_BURST_LEN 1 \
  CONFIG.C_M00_AXI_DATA_WIDTH 64 \
  CONFIG.C_M00_AXI_TARGET_SLAVE_BASE_ADDR 0x20000000 \
] [get_bd_cells interp_ip_0]
create_bd_cell -type ip -vlnv local:radar:scalar_gain:1.0 scalar_gain_0

# ---- connections ----

connect_bd_intf_net [get_bd_intf_pins axi_dma_0/M_AXI_S2MM] [get_bd_intf_pins smartconnect_cap_data/S00_AXI]
connect_bd_intf_net [get_bd_intf_pins axi_dma_0/M_AXI_SG] [get_bd_intf_pins smartconnect_cap_data/S01_AXI]
connect_bd_intf_net [get_bd_intf_pins axi_interconnect_0/M00_AXI] [get_bd_intf_pins zynq_ultra_ps_e_0/S_AXI_HP0_FPD]
connect_bd_intf_net [get_bd_intf_pins zynq_ultra_ps_e_0/S_AXI_HP3_FPD] [get_bd_intf_pins axi_interconnect_1/M00_AXI]
connect_bd_intf_net [get_bd_intf_pins axi_interconnect_2/M00_AXI] [get_bd_intf_pins zynq_ultra_ps_e_0/S_AXI_HP2_FPD]
connect_bd_intf_net [get_bd_intf_pins axi_interconnect_3/M00_AXI] [get_bd_intf_pins zynq_ultra_ps_e_0/S_AXI_HP1_FPD]
connect_bd_intf_net [get_bd_intf_pins axi_smc/M00_AXI] [get_bd_intf_pins ddr4_0/C0_DDR4_S_AXI]
connect_bd_intf_net [get_bd_intf_pins axis_data_fifo_cap/M_AXIS] [get_bd_intf_pins axi_dma_0/S_AXIS_S2MM]
connect_bd_intf_net [get_bd_intf_pins cam_axi_data_0/M00_AXI] [get_bd_intf_pins axi_smc/S00_AXI]
connect_bd_intf_net [get_bd_intf_ports c0_ddr4] [get_bd_intf_pins ddr4_0/C0_DDR4]
connect_bd_intf_net [get_bd_intf_pins display_0/M00_AXI] [get_bd_intf_pins axi_interconnect_3/S00_AXI]
connect_bd_intf_net [get_bd_intf_pins fftshift_write_0/M00_AXI] [get_bd_intf_pins axi_interconnect_1/S00_AXI]
connect_bd_intf_net [get_bd_intf_pins interp_ip_0/M00_AXI] [get_bd_intf_pins axi_interconnect_2/S00_AXI]
connect_bd_intf_net [get_bd_intf_pins oneburstwrite_0/M00_AXI] [get_bd_intf_pins axi_interconnect_0/S00_AXI]
connect_bd_intf_net [get_bd_intf_pins onedfftread_0/M00_AXI] [get_bd_intf_pins axi_interconnect_0/S01_AXI]
connect_bd_intf_net [get_bd_intf_pins scalar_gain_0/m_axi_mem] [get_bd_intf_pins axi_interconnect_1/S01_AXI]
connect_bd_intf_net [get_bd_intf_pins smartconnect_cap_ctrl/M00_AXI] [get_bd_intf_pins axi_dma_0/S_AXI_LITE]
connect_bd_intf_net [get_bd_intf_pins smartconnect_cap_ctrl/M01_AXI] [get_bd_intf_pins capture_status_gpio/S_AXI]
connect_bd_intf_net [get_bd_intf_pins smartconnect_cap_ctrl/M02_AXI] [get_bd_intf_pins network_status/S_AXI]
connect_bd_intf_net [get_bd_intf_pins smartconnect_cap_ctrl/M03_AXI] [get_bd_intf_pins frame_status/S_AXI]
connect_bd_intf_net [get_bd_intf_pins smartconnect_cap_data/M00_AXI] [get_bd_intf_pins zynq_ultra_ps_e_0/S_AXI_HPC0_FPD]
connect_bd_intf_net [get_bd_intf_pins zynq_ultra_ps_e_0/M_AXI_HPM0_FPD] [get_bd_intf_pins smartconnect_cap_ctrl/S00_AXI]
connect_bd_net -net DATA_RDAXI_0_m_axis_tvalid [get_bd_pins eth_udp_loop_0/fifo2fft_axis_tvalid] [get_bd_pins axis_dual_fork_0/s_axis_tvalid]
connect_bd_net [get_bd_pins H_CMOS_DISP/dout] [get_bd_pins ov5640_dri_0/cmos_h_pixel]
connect_bd_net [get_bd_ports cam_sda] [get_bd_pins gate_0/out]
connect_bd_net [get_bd_pins RGB888_0/data2] [get_bd_pins hdmi_picture2_0/cam_data_in]
connect_bd_net [get_bd_pins TOTAL_H_PIXEL/dout] [get_bd_pins ov5640_dri_0/total_h_pixel]
connect_bd_net [get_bd_pins TOTAL_V_PIXEL/dout] [get_bd_pins ov5640_dri_0/total_v_pixel]
connect_bd_net [get_bd_pins V_CMOS_DISP/dout] [get_bd_pins ov5640_dri_0/cmos_v_pixel]
connect_bd_net [get_bd_pins axis_data_fifo_0/m_axis_tdata] [get_bd_pins oneburstwrite_0/rd_1dfifo_data]
connect_bd_net [get_bd_pins axis_data_fifo_0/m_axis_tvalid] [get_bd_pins oneburstwrite_0/fifo_valid]
connect_bd_net [get_bd_pins axis_data_fifo_0/s_axis_tready] [get_bd_pins xfft_0/m_axis_data_tready]
connect_bd_net [get_bd_pins axis_data_fifo_1/axis_rd_data_count] [get_bd_pins fftshift_write_0/fifo_data_count]
connect_bd_net [get_bd_pins axis_data_fifo_1/m_axis_tdata] [get_bd_pins fftshift_write_0/fifo_data]
connect_bd_net [get_bd_pins axis_data_fifo_1/s_axis_tready] [get_bd_pins signal_delay_1/data_in]
connect_bd_net [get_bd_pins axis_data_fifo_cap/s_axis_tready] \
  [get_bd_pins axis_frame_tlast_0/s_axis_tready] [get_bd_pins axis_dual_fork_0/m01_axis_tready]
connect_bd_net [get_bd_pins axis_dual_fork_0/m00_axis_tdata] [get_bd_pins axis_fifo_image/s_axis_tdata]
connect_bd_net [get_bd_pins axis_dual_fork_0/m00_axis_tvalid] [get_bd_pins axis_fifo_image/s_axis_tvalid]
connect_bd_net [get_bd_pins axis_dual_fork_0/m01_axis_tdata] [get_bd_pins axis_data_fifo_cap/s_axis_tdata]
connect_bd_net [get_bd_pins axis_dual_fork_0/m01_axis_tvalid] \
  [get_bd_pins axis_data_fifo_cap/s_axis_tvalid] [get_bd_pins axis_frame_tlast_0/s_axis_tvalid]
connect_bd_net [get_bd_pins axis_fifo_image/m_axis_tdata] [get_bd_pins network_frame_control_0/s_axis_tdata]
connect_bd_net [get_bd_pins axis_fifo_image/m_axis_tvalid] [get_bd_pins network_frame_control_0/s_axis_tvalid]
connect_bd_net [get_bd_pins axis_fifo_image/s_axis_tready] [get_bd_pins axis_dual_fork_0/m00_axis_tready]
connect_bd_net [get_bd_pins axis_frame_tlast_0/m_axis_tlast] [get_bd_pins axis_data_fifo_cap/s_axis_tlast]
connect_bd_net [get_bd_pins blk_mem_gen_0/douta] [get_bd_pins fftshift_write_0/rom_data]
connect_bd_net -net c0_sys_clk_n_0_1 [get_bd_ports sys_clk_n] [get_bd_pins ddr4_0/c0_sys_clk_n]
connect_bd_net -net c0_sys_clk_p_0_1 [get_bd_ports sys_clk_p] [get_bd_pins ddr4_0/c0_sys_clk_p]
connect_bd_net [get_bd_pins c_addsub_0/S] [get_bd_pins fft2_64_0/fft2_data]
connect_bd_net [get_bd_pins cam_axi_data_0/cr_fifo_data] [get_bd_pins RGB888_0/data1]
connect_bd_net -net cam_data_0_1 [get_bd_ports cam_data] [get_bd_pins ov5640_dri_0/cam_data]
connect_bd_net -net cam_href_0_1 [get_bd_ports cam_href] [get_bd_pins ov5640_dri_0/cam_href]
connect_bd_net [get_bd_ports cam_pclk] [get_bd_pins ov5640_dri_0/cam_pclk] [get_bd_pins cam_axi_data_0/pixel_clk]
connect_bd_net -net cam_vsync_0_1 [get_bd_ports cam_vsync] [get_bd_pins ov5640_dri_0/cam_vsync]
connect_bd_net [get_bd_pins capture_fault_sync_0/fault_sync] [get_bd_pins capture_status_gpio/gpio_io_i]
connect_bd_net [get_bd_pins capture_keep/dout] [get_bd_pins axis_data_fifo_cap/s_axis_tkeep]
connect_bd_net -net capture_mode_decode_0_branch_enable [get_bd_pins network_mode_decode_0/branch_enable] [get_bd_pins axis_dual_fork_0/branch_enable]
connect_bd_net [get_bd_pins capture_status_gpio/gpio2_io_o] [get_bd_pins network_mode_decode_0/control]
connect_bd_net [get_bd_pins clk_wiz_1/clk_out1] \
  [get_bd_pins ila_0/clk] [get_bd_pins cam_axi_data_0/pclk] [get_bd_pins display_0/rd_clk] \
  [get_bd_pins hdmi_picture2_0/pixel_clk_1x]
# net clk_wiz_1_clk_out2 has one end: clk_wiz_1/clk_out2
connect_bd_net [get_bd_pins clk_wiz_1/clk_out3] [get_bd_pins hdmi_serdes_clocks_0/raw_clock]
connect_bd_net [get_bd_pins clk_wiz_1/locked] [get_bd_pins hdmi_serdes_clocks_0/reset_n]
connect_bd_net [get_bd_pins clk_wiz_3/clk_100] \
  [get_bd_pins clk_wiz_1/clk_in1] [get_bd_pins network_reset/slowest_sync_clk] [get_bd_pins network_cdc_0/slow_clk] \
  [get_bd_pins axi_interconnect_1/S01_ACLK] [get_bd_pins scalar_gain_0/ap_clk]
connect_bd_net [get_bd_pins clk_wiz_3/locked] [get_bd_pins proc_sys_reset_0/dcm_locked] [get_bd_pins network_reset/dcm_locked]
connect_bd_net [get_bd_pins data_saparate_0/img_part] [get_bd_pins mult_gen_1/A] [get_bd_pins mult_gen_1/B]
connect_bd_net [get_bd_pins data_saparate_0/real_part] [get_bd_pins mult_gen_0/B] [get_bd_pins mult_gen_0/A]
connect_bd_net [get_bd_pins ddr4_0/addn_ui_clkout1] [get_bd_pins ov5640_dri_0/clk]
connect_bd_net [get_bd_pins ddr4_0/c0_ddr4_ui_clk] \
  [get_bd_pins axi_smc/aclk] [get_bd_pins rst_ddr4_0_266M/slowest_sync_clk] [get_bd_pins cam_axi_data_0/m00_axi_aclk]
connect_bd_net [get_bd_pins ddr4_0/c0_ddr4_ui_clk_sync_rst] [get_bd_pins rst_ddr4_0_266M/ext_reset_in]
connect_bd_net [get_bd_pins ddr4_0/c0_init_calib_complete] [get_bd_pins ov5640_dri_0/capture_start]
connect_bd_net [get_bd_pins display_0/hdmi_start] [get_bd_pins ila_0/probe0] [get_bd_pins hdmi_picture2_0/rstn]
connect_bd_net [get_bd_pins display_0/rd_data_out] [get_bd_pins hdmi_picture2_0/data_in]
connect_bd_net -net eth_rx_ctl_0_1 [get_bd_ports eth_rx_ctl] [get_bd_pins eth_udp_loop_0/eth_rx_ctl]
connect_bd_net -net eth_rxc_0_1 [get_bd_ports eth_rxc] [get_bd_pins eth_udp_loop_0/eth_rxc]
connect_bd_net -net eth_rxd_0_1 [get_bd_ports eth_rxd] [get_bd_pins eth_udp_loop_0/eth_rxd]
connect_bd_net [get_bd_pins eth_udp_loop_0/axis_clk] \
  [get_bd_pins clk_wiz_3/clk_in1] [get_bd_pins xfft_0/aclk] [get_bd_pins proc_sys_reset_0/slowest_sync_clk] \
  [get_bd_pins zynq_ultra_ps_e_0/saxihp0_fpd_aclk] [get_bd_pins axi_interconnect_0/ACLK] \
  [get_bd_pins axi_interconnect_0/S00_ACLK] [get_bd_pins axi_interconnect_0/M00_ACLK] [get_bd_pins xfft_1/aclk] \
  [get_bd_pins axi_interconnect_0/S01_ACLK] [get_bd_pins fft_tlast_cnt_0/clk] [get_bd_pins mult_gen_1/CLK] \
  [get_bd_pins mult_gen_0/CLK] [get_bd_pins c_addsub_0/CLK] [get_bd_pins signal_delay_0/clk] [get_bd_pins signal_delay_1/clk] \
  [get_bd_pins axis_data_fifo_1/s_axis_aclk] [get_bd_pins blk_mem_gen_0/clka] [get_bd_pins axi_interconnect_1/ACLK] \
  [get_bd_pins axi_interconnect_1/S00_ACLK] [get_bd_pins axi_interconnect_1/M00_ACLK] \
  [get_bd_pins zynq_ultra_ps_e_0/saxihp3_fpd_aclk] [get_bd_pins debug_module_0/clk] \
  [get_bd_pins zynq_ultra_ps_e_0/saxihp2_fpd_aclk] [get_bd_pins axi_interconnect_2/ACLK] \
  [get_bd_pins axi_interconnect_2/S00_ACLK] [get_bd_pins axi_interconnect_2/M00_ACLK] \
  [get_bd_pins zynq_ultra_ps_e_0/saxihp1_fpd_aclk] [get_bd_pins axi_interconnect_3/ACLK] \
  [get_bd_pins axi_interconnect_3/S00_ACLK] [get_bd_pins axi_interconnect_3/M00_ACLK] \
  [get_bd_pins axis_data_fifo_0/s_axis_aclk] [get_bd_pins onedfftread_0/m00_axi_aclk] \
  [get_bd_pins oneburstwrite_0/m00_axi_aclk] [get_bd_pins zynq_ultra_ps_e_0/saxihpc0_fpd_aclk] \
  [get_bd_pins zynq_ultra_ps_e_0/maxihpm0_fpd_aclk] [get_bd_pins axis_fifo_image/s_axis_aclk] \
  [get_bd_pins axis_data_fifo_cap/s_axis_aclk] [get_bd_pins image_preprocess_0/clk] [get_bd_pins axis_frame_tlast_0/clk] \
  [get_bd_pins axi_dma_0/s_axi_lite_aclk] [get_bd_pins axi_dma_0/m_axi_s2mm_aclk] [get_bd_pins axi_dma_0/m_axi_sg_aclk] \
  [get_bd_pins smartconnect_cap_data/aclk] [get_bd_pins smartconnect_cap_ctrl/aclk] [get_bd_pins capture_fault_sync_0/clk] \
  [get_bd_pins capture_status_gpio/s_axi_aclk] [get_bd_pins axis_dual_fork_0/clk] [get_bd_pins network_frame_control_0/clk] \
  [get_bd_pins network_cdc_0/fast_clk] [get_bd_pins network_status/s_axi_aclk] [get_bd_pins frame_status/s_axi_aclk] \
  [get_bd_pins fftshift_write_0/m00_axi_aclk] [get_bd_pins display_0/m00_axi_aclk] [get_bd_pins interp_ip_0/m00_axi_aclk]
connect_bd_net [get_bd_pins eth_udp_loop_0/capture_fault] [get_bd_pins capture_fault_sync_0/fault_async]
connect_bd_net [get_bd_pins eth_udp_loop_0/eth_tx_ctl] [get_bd_ports eth_tx_ctl]
connect_bd_net [get_bd_pins eth_udp_loop_0/eth_txc] [get_bd_ports eth_txc]
connect_bd_net [get_bd_pins eth_udp_loop_0/eth_txd] [get_bd_ports eth_txd]
connect_bd_net [get_bd_pins eth_udp_loop_0/fifo2fft_axis_tdata] [get_bd_pins axis_dual_fork_0/s_axis_tdata]
connect_bd_net [get_bd_pins fft2_64_0/dataout] [get_bd_pins axis_data_fifo_1/s_axis_tdata]
connect_bd_net [get_bd_pins fftshift_write_0/fifo_ready] [get_bd_pins axis_data_fifo_1/m_axis_tready] [get_bd_pins debug_module_0/fftshift_w]
connect_bd_net [get_bd_pins fftshift_write_0/rom_addr] [get_bd_pins blk_mem_gen_0/addra]
connect_bd_net [get_bd_pins fftshift_write_0/rom_read_en] [get_bd_pins blk_mem_gen_0/ena]
connect_bd_net [get_bd_pins fftshift_write_0/w_frame_end] [get_bd_pins debug_module_0/frame_end] [get_bd_pins network_frame_control_0/fft_done]
connect_bd_net [get_bd_pins gate_0/sadi] [get_bd_pins ov5640_dri_0/cam_sda_i]
connect_bd_net [get_bd_pins hdmi_picture2_0/cam_fifo_en] [get_bd_pins cam_axi_data_0/cc_fifo_rd_en]
connect_bd_net [get_bd_pins hdmi_picture2_0/rfifo_rd_en] [get_bd_pins display_0/rd_en]
connect_bd_net [get_bd_pins hdmi_picture2_0/tmds_clk_n] [get_bd_ports tmds_clk_n]
connect_bd_net [get_bd_pins hdmi_picture2_0/tmds_clk_p] [get_bd_ports tmds_clk_p]
connect_bd_net [get_bd_pins hdmi_picture2_0/tmds_data_n] [get_bd_ports tmds_data_n]
connect_bd_net [get_bd_pins hdmi_picture2_0/tmds_data_p] [get_bd_ports tmds_data_p]
connect_bd_net [get_bd_pins hdmi_serdes_clocks_0/clock_2_5x] [get_bd_pins hdmi_picture2_0/pixel_clk_2_5x]
connect_bd_net [get_bd_pins hdmi_serdes_clocks_0/clock_5x] [get_bd_pins hdmi_picture2_0/pixel_clk_5x]
connect_bd_net -net image_mode_raw_dout [get_bd_pins network_mode_decode_0/mode_request] \
  [get_bd_pins image_preprocess_0/mode_request] [get_bd_pins network_frame_control_0/onebit_request]
connect_bd_net [get_bd_pins image_preprocess_0/m_axis_tdata] [get_bd_pins xfft_0/s_axis_data_tdata]
connect_bd_net [get_bd_pins image_preprocess_0/m_axis_tvalid] [get_bd_pins xfft_0/s_axis_data_tvalid] [get_bd_pins fft_tlast_cnt_0/data_valid]
connect_bd_net -net image_preprocess_0_s_axis_tready [get_bd_pins network_frame_control_0/s_axis_tready] [get_bd_pins axis_fifo_image/m_axis_tready]
connect_bd_net [get_bd_pins image_preprocess_0/s_axis_tready] [get_bd_pins network_frame_control_0/m_axis_tready]
connect_bd_net [get_bd_pins interp_ip_0/capture_start] [get_bd_pins network_frame_control_0/interp_done] [get_bd_pins display_0/capture_start]
connect_bd_net [get_bd_pins interp_ip_0/frame_flag] [get_bd_pins display_0/frame_flag]
connect_bd_net -net key_0_1 [get_bd_ports key0] [get_bd_pins eth_udp_loop_0/key]
connect_bd_net [get_bd_pins mult_gen_0/P] [get_bd_pins c_addsub_0/A]
connect_bd_net [get_bd_pins mult_gen_1/P] [get_bd_pins c_addsub_0/B]
connect_bd_net [get_bd_pins net_power_base/dout] [get_bd_pins scalar_gain_0/power]
connect_bd_net [get_bd_pins net_work_base/dout] [get_bd_pins scalar_gain_0/work]
connect_bd_net [get_bd_pins network_cdc_0/done_fast] [get_bd_pins network_frame_control_0/net_done]
connect_bd_net [get_bd_pins network_cdc_0/idle_fast] [get_bd_pins network_frame_control_0/net_idle]
connect_bd_net [get_bd_pins network_cdc_0/result_fast] [get_bd_pins network_frame_control_0/suppressed]
connect_bd_net [get_bd_pins network_cdc_0/start_slow] [get_bd_pins scalar_gain_0/ap_start]
connect_bd_net [get_bd_pins network_frame_control_0/admitted] [get_bd_pins frame_status/gpio_io_i]
connect_bd_net [get_bd_pins network_frame_control_0/interp_start] [get_bd_pins interp_ip_0/fft2_done]
connect_bd_net [get_bd_pins network_frame_control_0/last_cycles] [get_bd_pins network_status/gpio2_io_i]
connect_bd_net [get_bd_pins network_frame_control_0/m_axis_tdata] [get_bd_pins image_preprocess_0/s_axis_tdata]
connect_bd_net [get_bd_pins network_frame_control_0/m_axis_tvalid] [get_bd_pins image_preprocess_0/s_axis_tvalid]
connect_bd_net [get_bd_pins network_frame_control_0/net_start] [get_bd_pins network_cdc_0/start_fast]
connect_bd_net [get_bd_pins network_frame_control_0/skipped] [get_bd_pins frame_status/gpio2_io_i]
connect_bd_net [get_bd_pins network_frame_control_0/status] [get_bd_pins network_status/gpio_io_i]
connect_bd_net [get_bd_pins network_mode_decode_0/network_request] [get_bd_pins network_frame_control_0/network_request]
connect_bd_net [get_bd_pins network_reset/peripheral_aresetn] \
  [get_bd_pins network_cdc_0/slow_rst_n] [get_bd_pins axi_interconnect_1/S01_ARESETN] [get_bd_pins scalar_gain_0/ap_rst_n]
connect_bd_net [get_bd_pins oneburstwrite_0/block_flag] [get_bd_pins onedfftread_0/frame_flag]
connect_bd_net [get_bd_pins oneburstwrite_0/frame_end] [get_bd_pins fft_tlast_cnt_0/onewrite_start] [get_bd_pins onedfftread_0/frame_end]
connect_bd_net [get_bd_pins oneburstwrite_0/rd_1dfifo_en] [get_bd_pins axis_data_fifo_0/m_axis_tready]
connect_bd_net [get_bd_pins onedfftread_0/m_axis_tdata] [get_bd_pins xfft_1/s_axis_data_tdata]
connect_bd_net [get_bd_pins onedfftread_0/m_axis_tvalid] [get_bd_pins xfft_1/s_axis_data_tvalid] [get_bd_pins fft_tlast_cnt_0/oned_fft_ready]
connect_bd_net [get_bd_pins ov5640_dri_0/cam_pwdn] [get_bd_ports cam_pwdn]
connect_bd_net [get_bd_pins ov5640_dri_0/cam_rst_n] [get_bd_ports cam_rst_n]
connect_bd_net [get_bd_pins ov5640_dri_0/cam_scl] [get_bd_ports cam_scl]
connect_bd_net [get_bd_pins ov5640_dri_0/cam_sda_o] [get_bd_pins gate_0/in]
connect_bd_net [get_bd_pins ov5640_dri_0/cam_sda_t] [get_bd_pins gate_0/en]
connect_bd_net [get_bd_pins ov5640_dri_0/cmos_frame_data] [get_bd_pins rgb24_0/datain]
connect_bd_net [get_bd_pins ov5640_dri_0/cmos_frame_valid] [get_bd_pins cam_axi_data_0/data_valid]
connect_bd_net [get_bd_pins proc_sys_reset_0/interconnect_aresetn] \
  [get_bd_pins axi_interconnect_0/M00_ARESETN] [get_bd_pins axi_interconnect_0/S00_ARESETN] \
  [get_bd_pins axi_interconnect_0/ARESETN] [get_bd_pins axi_interconnect_0/S01_ARESETN] \
  [get_bd_pins axi_interconnect_1/ARESETN] [get_bd_pins axi_interconnect_1/S00_ARESETN] \
  [get_bd_pins axi_interconnect_1/M00_ARESETN] [get_bd_pins axi_interconnect_2/M00_ARESETN] \
  [get_bd_pins axi_interconnect_2/ARESETN] [get_bd_pins axi_interconnect_2/S00_ARESETN] \
  [get_bd_pins axi_interconnect_3/ARESETN] [get_bd_pins axi_interconnect_3/S00_ARESETN] \
  [get_bd_pins axi_interconnect_3/M00_ARESETN] [get_bd_pins smartconnect_cap_data/aresetn] \
  [get_bd_pins smartconnect_cap_ctrl/aresetn]
connect_bd_net [get_bd_pins proc_sys_reset_0/peripheral_aresetn] \
  [get_bd_pins fft_tlast_cnt_0/rstn] [get_bd_pins debug_module_0/rstn] [get_bd_pins axis_data_fifo_0/s_axis_aresetn] \
  [get_bd_pins onedfftread_0/m00_axi_aresetn] [get_bd_pins oneburstwrite_0/m00_axi_aresetn] \
  [get_bd_pins axis_fifo_image/s_axis_aresetn] [get_bd_pins axis_data_fifo_cap/s_axis_aresetn] \
  [get_bd_pins image_preprocess_0/rst_n] [get_bd_pins axis_frame_tlast_0/rst_n] [get_bd_pins axi_dma_0/axi_resetn] \
  [get_bd_pins capture_fault_sync_0/rst_n] [get_bd_pins capture_status_gpio/s_axi_aresetn] \
  [get_bd_pins axis_dual_fork_0/rst_n] [get_bd_pins network_frame_control_0/rst_n] [get_bd_pins network_cdc_0/fast_rst_n] \
  [get_bd_pins network_status/s_axi_aresetn] [get_bd_pins frame_status/s_axi_aresetn] \
  [get_bd_pins fftshift_write_0/m00_axi_aresetn] [get_bd_pins display_0/m00_axi_aresetn] \
  [get_bd_pins interp_ip_0/m00_axi_aresetn]
connect_bd_net [get_bd_pins rgb24_0/dataout] [get_bd_pins cam_axi_data_0/pixel_rgb]
connect_bd_net [get_bd_pins rst_ddr4_0_266M/peripheral_aresetn] \
  [get_bd_pins ddr4_0/c0_ddr4_aresetn] [get_bd_pins axi_smc/aresetn] [get_bd_pins cam_axi_data_0/m00_axi_aresetn]
connect_bd_net [get_bd_pins scalar_gain_0/ap_done] [get_bd_pins network_cdc_0/done_slow]
connect_bd_net [get_bd_pins scalar_gain_0/ap_idle] [get_bd_pins network_cdc_0/idle_slow]
connect_bd_net [get_bd_pins scalar_gain_0/suppressed] [get_bd_pins network_cdc_0/result_slow]
connect_bd_net [get_bd_pins signal_delay_0/data_out] [get_bd_pins axis_data_fifo_1/s_axis_tvalid] [get_bd_pins debug_module_0/fft2d_valid]
connect_bd_net [get_bd_pins signal_delay_1/data_out] [get_bd_pins xfft_1/m_axis_data_tready]
connect_bd_net -net sys_rst_n_0_1 [get_bd_ports sys_rst_n] \
  [get_bd_pins ov5640_dri_0/rst_n] [get_bd_pins util_vector_logic_0/Op1] [get_bd_pins eth_udp_loop_0/sys_rst_n]
connect_bd_net [get_bd_pins util_vector_logic_0/Res] [get_bd_pins ddr4_0/sys_rst]
connect_bd_net [get_bd_pins xfft_0/m_axis_data_tdata] [get_bd_pins fft_saparate_0/fft_1ddata] [get_bd_pins axis_data_fifo_0/s_axis_tdata]
connect_bd_net [get_bd_pins xfft_0/m_axis_data_tlast] [get_bd_pins oneburstwrite_0/fft_last]
connect_bd_net [get_bd_pins xfft_0/m_axis_data_tvalid] [get_bd_pins axis_data_fifo_0/s_axis_tvalid]
connect_bd_net -net xfft_0_s_axis_data_tready [get_bd_pins axis_dual_fork_0/s_axis_tready] [get_bd_pins eth_udp_loop_0/fifo2fft_axis_tready]
connect_bd_net [get_bd_pins xfft_0/s_axis_data_tready] [get_bd_pins image_preprocess_0/m_axis_tready] [get_bd_pins fft_tlast_cnt_0/data_ready]
connect_bd_net [get_bd_pins xfft_1/m_axis_data_tdata] [get_bd_pins data_saparate_0/fft2d_data]
connect_bd_net [get_bd_pins xfft_1/m_axis_data_tvalid] [get_bd_pins signal_delay_0/data_in]
connect_bd_net [get_bd_pins xfft_1/s_axis_data_tready] [get_bd_pins fft_tlast_cnt_0/oned_fft_valid] [get_bd_pins onedfftread_0/m_axis_tready]
connect_bd_net [get_bd_pins xlconstant_0/dout] [get_bd_pins xfft_1/s_axis_config_tdata]
connect_bd_net [get_bd_pins xlconstant_1/dout] [get_bd_pins xfft_1/s_axis_config_tvalid] [get_bd_pins axis_data_fifo_1/s_axis_aresetn]
connect_bd_net [get_bd_pins xlconstant_2/dout] [get_bd_pins xfft_0/s_axis_config_tdata]
connect_bd_net [get_bd_pins xlconstant_3/dout] [get_bd_pins xfft_0/s_axis_config_tvalid]
connect_bd_net [get_bd_pins xlconstant_4/dout] [get_bd_pins xfft_1/s_axis_data_tlast]
connect_bd_net [get_bd_pins xlconstant_5/dout] [get_bd_pins xfft_0/s_axis_data_tlast]
connect_bd_net [get_bd_pins zynq_ultra_ps_e_0/pl_resetn0] [get_bd_pins proc_sys_reset_0/ext_reset_in] [get_bd_pins network_reset/ext_reset_in]

# ---- address map ----
assign_bd_address -offset 0x20000000 -range 256M -target_address_space [get_bd_addr_spaces axi_dma_0/Data_S2MM] [get_bd_addr_segs zynq_ultra_ps_e_0/SAXIGP0/HPC0_DDR_LOW]
assign_bd_address -offset 0x20000000 -range 256M -target_address_space [get_bd_addr_spaces axi_dma_0/Data_SG] [get_bd_addr_segs zynq_ultra_ps_e_0/SAXIGP0/HPC0_DDR_LOW]
assign_bd_address -offset 0x80000000 -range 512M -target_address_space [get_bd_addr_spaces cam_axi_data_0/M00_AXI] [get_bd_addr_segs ddr4_0/C0_DDR4_MEMORY_MAP/C0_DDR4_ADDRESS_BLOCK]
assign_bd_address -offset 0x00000000 -range 2G -target_address_space [get_bd_addr_spaces display_0/M00_AXI] [get_bd_addr_segs zynq_ultra_ps_e_0/SAXIGP3/HP1_DDR_LOW]
assign_bd_address -offset 0xFF000000 -range 16M -target_address_space [get_bd_addr_spaces display_0/M00_AXI] [get_bd_addr_segs zynq_ultra_ps_e_0/SAXIGP3/HP1_LPS_OCM]
assign_bd_address -offset 0x00000000 -range 2G -target_address_space [get_bd_addr_spaces fftshift_write_0/M00_AXI] [get_bd_addr_segs zynq_ultra_ps_e_0/SAXIGP5/HP3_DDR_LOW]
assign_bd_address -offset 0xFF000000 -range 16M -target_address_space [get_bd_addr_spaces fftshift_write_0/M00_AXI] [get_bd_addr_segs zynq_ultra_ps_e_0/SAXIGP5/HP3_LPS_OCM]
assign_bd_address -offset 0x00000000 -range 2G -target_address_space [get_bd_addr_spaces interp_ip_0/M00_AXI] [get_bd_addr_segs zynq_ultra_ps_e_0/SAXIGP4/HP2_DDR_LOW]
assign_bd_address -offset 0xFF000000 -range 16M -target_address_space [get_bd_addr_spaces interp_ip_0/M00_AXI] [get_bd_addr_segs zynq_ultra_ps_e_0/SAXIGP4/HP2_LPS_OCM]
assign_bd_address -offset 0x00000000 -range 2G -target_address_space [get_bd_addr_spaces oneburstwrite_0/M00_AXI] [get_bd_addr_segs zynq_ultra_ps_e_0/SAXIGP2/HP0_DDR_LOW]
assign_bd_address -offset 0xFF000000 -range 16M -target_address_space [get_bd_addr_spaces oneburstwrite_0/M00_AXI] [get_bd_addr_segs zynq_ultra_ps_e_0/SAXIGP2/HP0_LPS_OCM]
assign_bd_address -offset 0x00000000 -range 2G -target_address_space [get_bd_addr_spaces onedfftread_0/M00_AXI] [get_bd_addr_segs zynq_ultra_ps_e_0/SAXIGP2/HP0_DDR_LOW]
assign_bd_address -offset 0xFF000000 -range 16M -target_address_space [get_bd_addr_spaces onedfftread_0/M00_AXI] [get_bd_addr_segs zynq_ultra_ps_e_0/SAXIGP2/HP0_LPS_OCM]
assign_bd_address -offset 0x00000000 -range 2G -target_address_space [get_bd_addr_spaces scalar_gain_0/Data_m_axi_mem] [get_bd_addr_segs zynq_ultra_ps_e_0/SAXIGP5/HP3_DDR_LOW]
assign_bd_address -offset 0x00A0000000 -range 64K -target_address_space [get_bd_addr_spaces zynq_ultra_ps_e_0/Data] [get_bd_addr_segs axi_dma_0/S_AXI_LITE/Reg]
assign_bd_address -offset 0x00A0010000 -range 64K -target_address_space [get_bd_addr_spaces zynq_ultra_ps_e_0/Data] [get_bd_addr_segs capture_status_gpio/S_AXI/Reg]
assign_bd_address -offset 0x00A0020000 -range 64K -target_address_space [get_bd_addr_spaces zynq_ultra_ps_e_0/Data] [get_bd_addr_segs network_status/S_AXI/Reg]
assign_bd_address -offset 0x00A0030000 -range 64K -target_address_space [get_bd_addr_spaces zynq_ultra_ps_e_0/Data] [get_bd_addr_segs frame_status/S_AXI/Reg]

validate_bd_design
save_bd_design
